# Altium schematic sheet push-button-switch-9.SchDoc
size A4; SheetNumber: 9; SheetTotal: 17
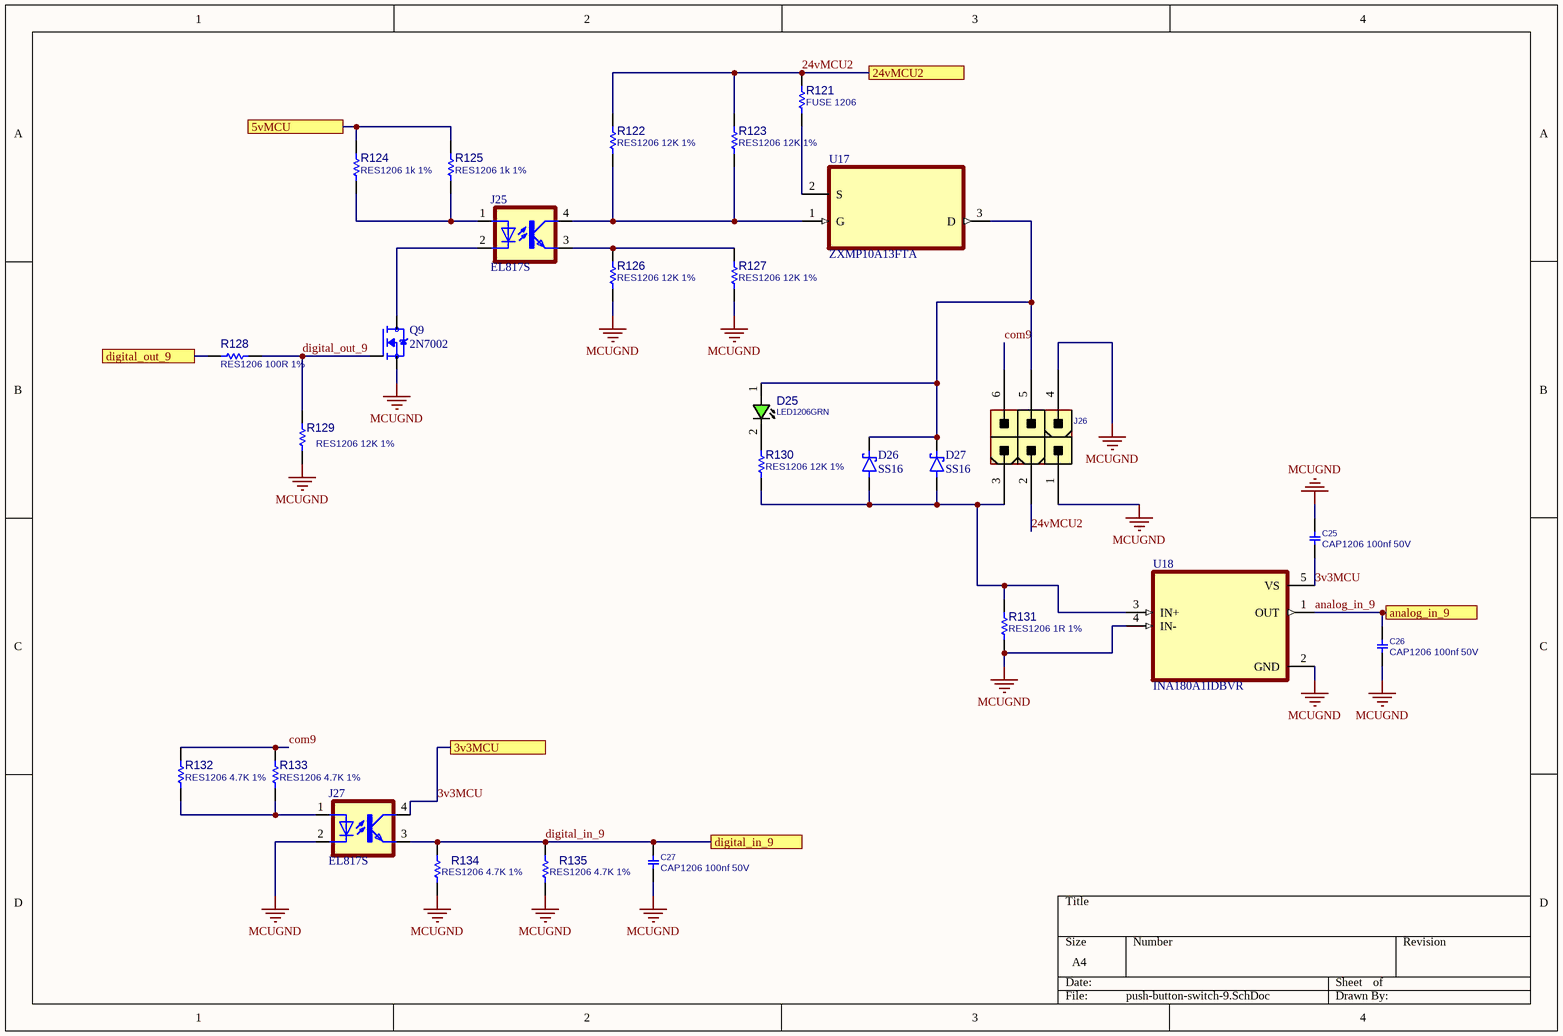
[diagram p0: push-button-switch-9.SchDoc]

## Parts
C25  CAP1206 100nf 50V  [C1206]
C26  CAP1206 100nf 50V  [C1206]
C27  CAP1206 100nf 50V  [C1206]
D25  LED1206GRN  [LED1206GRN]
D26  SS16  [DIOM4325X250N]
D27  SS16  [DIOM4325X250N]
J25  EL817S  [SOIC254P1030X460-4N]
J26  CONN_ATXPWR_6  [ATXPWR_6]  (value not drawn)
J27  EL817S  [SOIC254P1030X460-4N]
Q9  2N7002  [SOT95P240X111-3N]
R121  FUSE 1206  [R1206]
R122  RES1206 12K 1%  [R1206]
R123  RES1206 12K 1%  [R1206]
R124  RES1206 1k 1%  [R1206]
R125  RES1206 1k 1%  [R1206]
R126  RES1206 12K 1%  [R1206]
R127  RES1206 12K 1%  [R1206]
R128  RES1206 100R 1%  [R1206]
R129  RES1206 12K 1%  [R1206]
R130  RES1206 12K 1%  [R1206]
R131  RES1206 1R 1%  [R1206]
R132  RES1206 4.7K 1%  [R1206]
R133  RES1206 4.7K 1%  [R1206]
R134  RES1206 4.7K 1%  [R1206]
R135  RES1206 4.7K 1%  [R1206]
U17  ZXMP10A13FTA  [SOT95P230X110-3N]
U18  INA180A1IDBVR  [SOT95P280X145-5N]

## Ports
3v3MCU, 5vMCU, 24vMCU2, analog_in_9, digital_in_9, digital_out_9

## Nets
MCUGND: C25.1 C26.2 C27.2 J26.1 J26.4 J27.2(C) Q9.2(S) R126.2 R127.2 R129.2 R131.2 R134.1 R135.1 U18.2(GND) U18.4(IN-)
3v3MCU: C25.2 J27.4(COL) U18.5(VS) ; port 3v3MCU
5vMCU: R124.2 R125.2 ; port 5vMCU
24vMCU2: J26.2 R121.1 R122.1 R123.1 ; port 24vMCU2
analog_in_9: C26.1 U18.1(OUT) ; port analog_in_9
com9: J26.6 R132.2 R133.2
digital_in_9: C27.1 J27.3(EMIT) R134.2 R135.2 ; port digital_in_9
digital_out_9: Q9.1(G) R128.2 R129.1
digital_out_9: R128.1 ; port digital_out_9  [a separate net that carries the same name]
NetD25_1: D25.1(ANODE) D26.C(K) D27.C(K) J26.5 U17.3(D)
NetD25_2: D25.2(CATHODE) R130.1
NetD26_A: D26.A D27.A J26.3 R130.2 R131.1 U18.3(IN+)
NetJ25_1: J25.1(A) R124.1 R125.1
NetJ25_2: J25.2(C) Q9.3(D)
NetJ25_3: J25.3(EMIT) R126.1 R127.1
NetJ25_4: J25.4(COL) R122.2 R123.2 U17.1(G)
NetJ27_1: J27.1(A) R132.1 R133.1
NetR121_2: R121.2 U17.2(S)

## Library data of the parts
C25-C27 = CAP_SMD_MLCC_1206: CAP, MLCC; PARAM: -, -%; MANF_P#: MANF_PART#; PARAM2: -V; PRICE: 100= 1$; MANF: -; ASSEMBLY: ASSEMBLY
D25 = LED_SMD_1206_GRN: LED, SMD, 1206, GREEN; PARAM: 20mA; DESC: DESCRIPTION; PARAM2: 2.2V; MANF: -; ASSEMBLY: ASSEMBLY; PRICE: 36t@Javan; MANF_P#: -; VALUE: LED1206GRN; MountType: SMT; PartType: LED
D26 D27 = SS14: 1A, 40V, Schottky Rectifier; MF: Taiwan Semiconductor; SnapEDA_Link: https://www.snapeda.com/parts/SS14/taiwan/view-part/?ref=snap; Package: SMA-2 Taiwan Semiconductor; Value: *; MP: SS14; Check_prices: https://www.snapeda.com/parts/SS14/taiwan/view-part/?ref=eda
J25 J27 = EL817S: Optoisolator Transistor Output 5000Vrms 1 Channel 4-SMD; MF: Everlight Electronics; SnapEDA_Link: https://www.snapeda.com/parts/EL817S/Everlight+Electronics+Co+Ltd/view-part/?ref=snap; Package: SMD-4 Everlight Electronics Co Ltd; Value: *; MP: EL817S; Check_prices: https://www.snapeda.com/parts/EL817S/Everlight+Electronics+Co+Ltd/view-part/?ref=eda
J26 = CONN_ATXPWR_6: CONN, ATX POWER, 6 P; MANF: TE; MANF_P#: 4-1775099-1; VALUE: CONN_ATXPWR_6; MountType: THD; PACKAGE: ATXPWR-6pin; Part Type: Conn.
Q9 = 2N7002: N-Channel 60V 280mA (Ta) 350mW (Ta) Surface Mount SOT-23-3 (TO-236); MF: {'manufacturer': u'onsemi'}; Package: None; Price: None; Value: *; MP: 2N7002; Availability: Unavailable
R121-R135 = RES_SMD_1206: RESISTOR, SMD; PARAM: 1%, 0.25W; DESC: DESCRIPTION; DIST#: MOUSER; MANF_P#: -; MANF: -; ASSEMBLY: ASSEMBLY; PRICE: -; PARAM2: -
U17 = ZXMP10A13FTA: P-Channel 100 V 600mA (Ta) 625mW (Ta) Surface Mount SOT-23-3; MF: Diodes Inc.; Purchase-URL: https://pricing.snapeda.com/search/part/ZXMP10A13FTA/?ref=eda; Package: SOT-23-3 Diodes Inc.; SnapEDA_Link: https://www.snapeda.com/parts/ZXMP10A13FTA/Diodes+Inc./view-part/?ref=snap; Availability: In Stock; Value: *; MP: ZXMP10A13FTA; Check_prices: https://www.snapeda.com/parts/ZXMP10A13FTA/Diodes+Inc./view-part/?ref=eda; Price: None
U18 = INA180A1IDBVR: 26V, 350kHz current sense amplifier; MF: Texas Instruments; SnapEDA_Link: https://www.snapeda.com/parts/INA180A1IDBVR/Texas+Instruments/view-part/?ref=snap; Package: SOT-23-5 Texas Instruments; Value: *; MP: INA180A1IDBVR; Check_prices: https://www.snapeda.com/parts/INA180A1IDBVR/Texas+Instruments/view-part/?ref=eda